# EAGLE design fuente (EAGLE 9.6.2)
Fuente ±16 V / 1,5 A y +5 V (v2.2) - Brahiam Alberto Campiño Romero
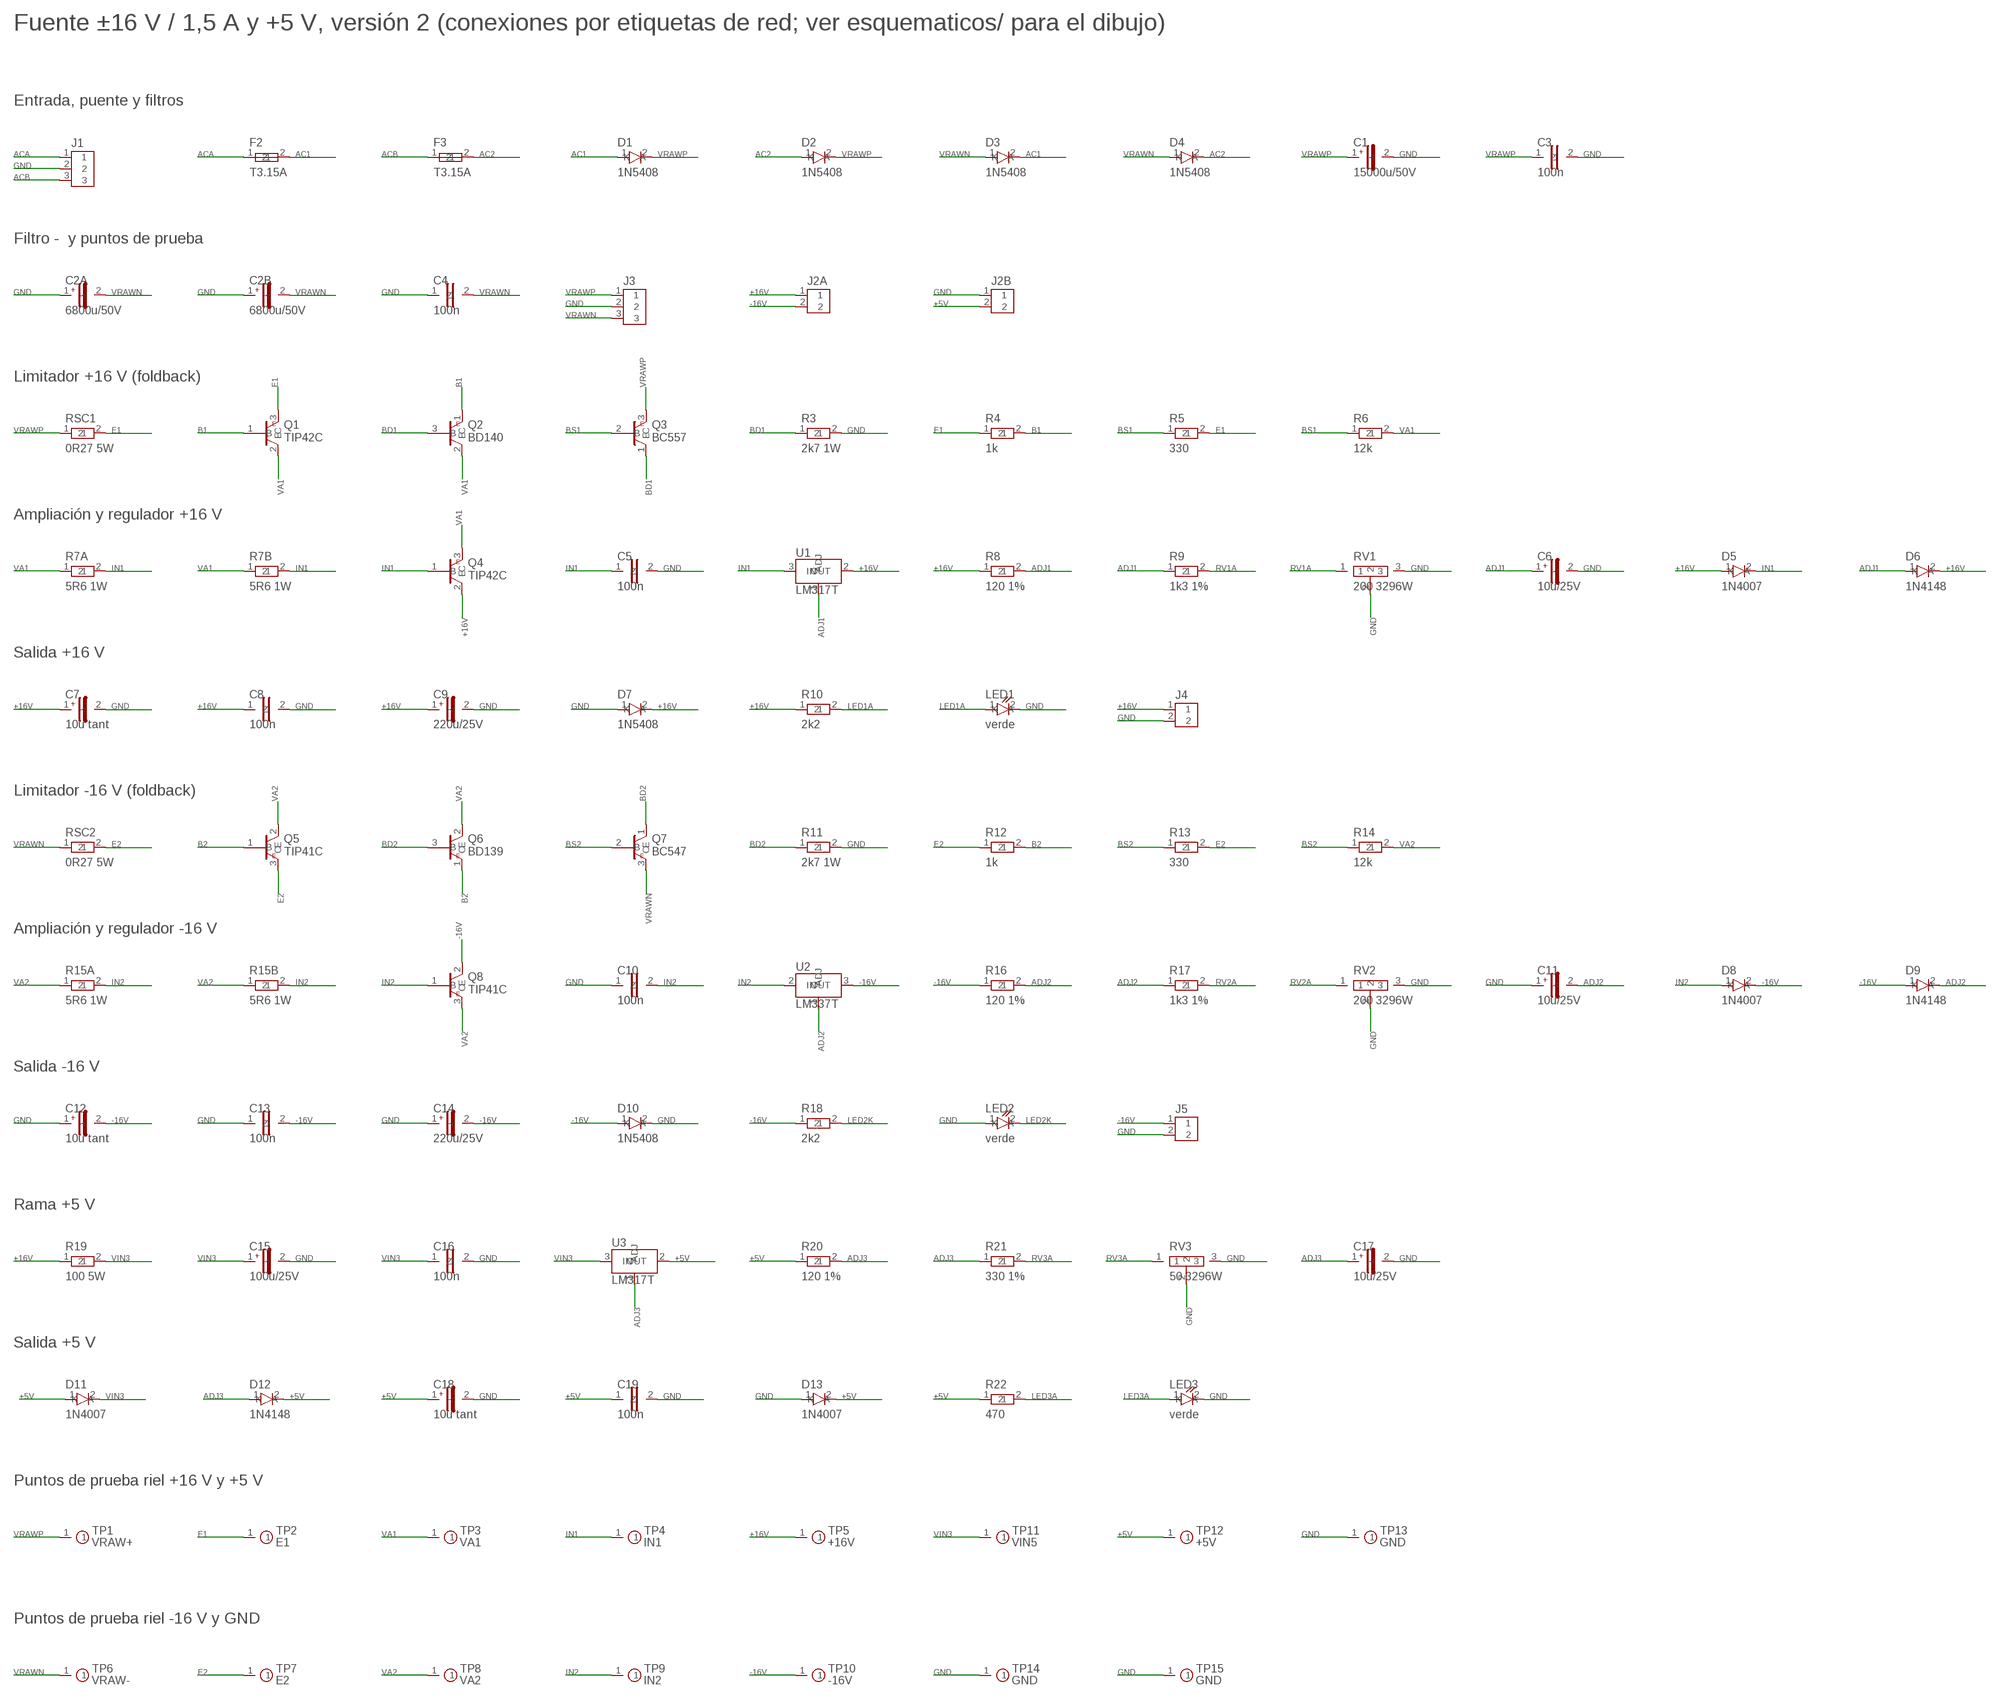
[diagram p0: schematic, sheet 1]

## Parts
C1  15000u/50V  CPOL35  [CPOL35]
C2A  6800u/50V  CPOL25  [CPOL25]
C2B  6800u/50V  CPOL25  [CPOL25]
C3  100n  C  [CAP]
C4  100n  C  [CAP]
C5  100n  C  [CAP]
C6  10u/25V  CPOL5  [CPOL5]
C7  10u tant  CTANT  [CTANT]
C8  100n  C  [CAP]
C9  220u/25V  CPOL8  [CPOL8]
C10  100n  C  [CAP]
C11  10u/25V  CPOL5  [CPOL5]
C12  10u tant  CTANT  [CTANT]
C13  100n  C  [CAP]
C14  220u/25V  CPOL8  [CPOL8]
C15  100u/25V  CPOL6  [CPOL6]
C16  100n  C  [CAP]
C17  10u/25V  CPOL5  [CPOL5]
C18  10u tant  CTANT  [CTANT]
C19  100n  C  [CAP]
D1  1N5408  D201  [DIODE]
D2  1N5408  D201  [DIODE]
D3  1N5408  D201  [DIODE]
D4  1N5408  D201  [DIODE]
D5  1N4007  D41  [DO41]
D6  1N4148  D35  [DO35]
D7  1N5408  D201  [DIODE]
D8  1N4007  D41  [DO41]
D9  1N4148  D35  [DO35]
D10  1N5408  D201  [DIODE]
D11  1N4007  D41  [DO41]
D12  1N4148  D35  [DO35]
D13  1N4007  D41  [DO41]
F2  T3.15A  FUSE  [FUSE]
F3  T3.15A  FUSE  [FUSE]
J1  SEC 18-0-18  TERM3  [TERM3]
J2A  +16/-16  TERM2  [TERM2]
J2B  GND/+5  TERM2  [TERM2]
J3  TP  HDR3  [HDR3]
J4  RL +16  TERM2  [TERM2]
J5  RL -16  TERM2  [TERM2]
LED1  verde  LED  [LED5]
LED2  verde  LED  [LED5]
LED3  verde  LED  [LED5]
Q1  TIP42C  [TO220]
Q2  BD140  [TO126]
Q3  BC557  [TO92]
Q4  TIP42C  [TO220]
Q5  TIP41C  [TO220]
Q6  BD139  [TO126]
Q7  BC547  [TO92]
Q8  TIP41C  [TO220]
R3  2k7 1W  R1W  [RES1W]
R4  1k  R10  [RES10]
R5  330  R10  [RES10]
R6  12k  R10  [RES10]
R7A  5R6 1W  R1W  [RES1W]
R7B  5R6 1W  R1W  [RES1W]
R8  120 1%  R10  [RES10]
R9  1k3 1%  R10  [RES10]
R10  2k2  R10  [RES10]
R11  2k7 1W  R1W  [RES1W]
R12  1k  R10  [RES10]
R13  330  R10  [RES10]
R14  12k  R10  [RES10]
R15A  5R6 1W  R1W  [RES1W]
R15B  5R6 1W  R1W  [RES1W]
R16  120 1%  R10  [RES10]
R17  1k3 1%  R10  [RES10]
R18  2k2  R10  [RES10]
R19  100 5W  R3W  [RES3W]
R20  120 1%  R10  [RES10]
R21  330 1%  R10  [RES10]
R22  470  R10  [RES10]
RSC1  0R27 5W  R5W  [RES5W]
RSC2  0R27 5W  R5W  [RES5W]
RV1  200 3296W  TRIM  [TRIM]
RV2  200 3296W  TRIM  [TRIM]
RV3  50 3296W  TRIM  [TRIM]
TP1  VRAW+  TP  [TP]
TP2  E1  TP  [TP]
TP3  VA1  TP  [TP]
TP4  IN1  TP  [TP]
TP5  +16V  TP  [TP]
TP6  VRAW-  TP  [TP]
TP7  E2  TP  [TP]
TP8  VA2  TP  [TP]
TP9  IN2  TP  [TP]
TP10  -16V  TP  [TP]
TP11  VIN5  TP  [TP]
TP12  +5V  TP  [TP]
TP13  GND  TP  [TP]
TP14  GND  TP  [TP]
TP15  GND  TP  [TP]
U1  LM317T  [TO220]
U2  LM337T  [TO220]
U3  LM317T  [TO220]

## Nets
+5V: C18.1(+) C19.1 D11.1(A) D12.2(K) D13.2(K) J2B.2 R20.1 R22.1 TP12.1 U3.2(OUT)
+16V: C7.1(+) C8.1 C9.1(+) D5.1(A) D6.2(K) D7.2(K) J2A.1 J4.1 Q4.2(C) R8.1 R10.1 R19.1 TP5.1 U1.2(OUT)
-16V: C12.2(-) C13.2 C14.2(-) D8.2(K) D9.1(A) D10.1(A) J2A.2 J5.1 Q8.2(C) R16.1 R18.1 TP10.1 U2.3(OUT)
AC1: D1.1(A) D3.2(K) F2.2
AC2: D2.1(A) D4.2(K) F3.2
ACA: F2.1 J1.1
ACB: F3.1 J1.3
ADJ1: C6.1(+) D6.1(A) R8.2 R9.1 U1.1(ADJ)
ADJ2: C11.2(-) D9.2(K) R16.2 R17.1 U2.1(ADJ)
ADJ3: C17.1(+) D12.1(A) R20.2 R21.1 U3.1(ADJ)
B1: Q1.1(B) Q2.1(E) R4.2
B2: Q5.1(B) Q6.1(E) R12.2
BD1: Q2.3(B) Q3.1(C) R3.1
BD2: Q6.3(B) Q7.1(C) R11.1
BS1: Q3.2(B) R5.1 R6.1
BS2: Q7.2(B) R13.1 R14.1
E1: Q1.3(E) R4.1 R5.2 RSC1.2 TP2.1
E2: Q5.3(E) R12.1 R13.2 RSC2.2 TP7.1
GND: C1.2(-) C2A.1(+) C2B.1(+) C3.2 C4.1 C5.2 C6.2(-) C7.2(-) C8.2 C9.2(-) C10.1 C11.1(+) C12.1(+) C13.1 C14.1(+) C15.2(-) C16.2 C17.2(-) C18.2(-) C19.2 D7.1(A) D10.2(K) D13.1(A) J1.2 J2B.1 J3.2 J4.2 J5.2 LED1.2(K) LED2.1(A) LED3.2(K) R3.2 R11.2 RV1.2 RV1.3 RV2.2 RV2.3 RV3.2 RV3.3 TP13.1 TP14.1 TP15.1
IN1: C5.1 D5.2(K) Q4.1(B) R7A.2 R7B.2 TP4.1 U1.3(IN)
IN2: C10.2 D8.1(A) Q8.1(B) R15A.2 R15B.2 TP9.1 U2.2(IN)
LED1A: LED1.1(A) R10.2
LED2K: LED2.2(K) R18.2
LED3A: LED3.1(A) R22.2
RV1A: R9.2 RV1.1
RV2A: R17.2 RV2.1
RV3A: R21.2 RV3.1
VA1: Q1.2(C) Q2.2(C) Q4.3(E) R6.2 R7A.1 R7B.1 TP3.1
VA2: Q5.2(C) Q6.2(C) Q8.3(E) R14.2 R15A.1 R15B.1 TP8.1
VIN3: C15.1(+) C16.1 D11.2(K) R19.2 TP11.1 U3.3(IN)
VRAWN: C2A.2(-) C2B.2(-) C4.2 D3.1(A) D4.1(A) J3.3 Q7.3(E) RSC2.1 TP6.1
VRAWP: C1.1(+) C3.1 D1.2(K) D2.2(K) J3.1 Q3.3(E) RSC1.1 TP1.1

## Notes on the sheet
- Fuente ±16 V / 1,5 A y +5 V, versión 2 (conexiones por etiquetas de red; ver esquematicos/ para el dibujo)
- Entrada, puente y filtros
- Filtro -  y puntos de prueba
- Limitador +16 V (foldback)
- Ampliación y regulador +16 V
- Salida +16 V
- Limitador -16 V (foldback)
- Ampliación y regulador -16 V
- Salida -16 V
- Rama +5 V
- Salida +5 V
- Puntos de prueba riel +16 V y +5 V
- Puntos de prueba riel -16 V y GND

## Library data of the parts
C1 = fuente16:CPOL35
C2A C2B = fuente16:CPOL25
C3-C5 C8 C10 C13 C16 C19 = fuente16:C
C6 C11 C17 = fuente16:CPOL5
C7 C12 C18 = fuente16:CTANT
C9 C14 = fuente16:CPOL8
C15 = fuente16:CPOL6
D1-D4 D7 D10 = fuente16:D201
D5 D8 D11 D13 = fuente16:D41
D6 D9 D12 = fuente16:D35
F2 F3 = fuente16:FUSE
J1 = fuente16:TERM3
J2A J2B J4 J5 = fuente16:TERM2
J3 = fuente16:HDR3
LED1-LED3 = fuente16:LED
Q1 Q4 = fuente16:TIP42C
Q2 = fuente16:BD140
Q3 = fuente16:BC557
Q5 Q8 = fuente16:TIP41C
Q6 = fuente16:BD139
Q7 = fuente16:BC547
R3 R7A R7B R11 R15A R15B = fuente16:R1W
R4-R6 R8-R10 R12-R14 R16-R18 R20-R22 = fuente16:R10
R19 = fuente16:R3W
RSC1 RSC2 = fuente16:R5W
RV1-RV3 = fuente16:TRIM
TP1-TP15 = fuente16:TP
U1 U3 = fuente16:LM317T
U2 = fuente16:LM337T

## Board
Fuente ±16 V / 1,5 A y +5 V (v2.2), una cara (cobre inferior) con puentes de alambre
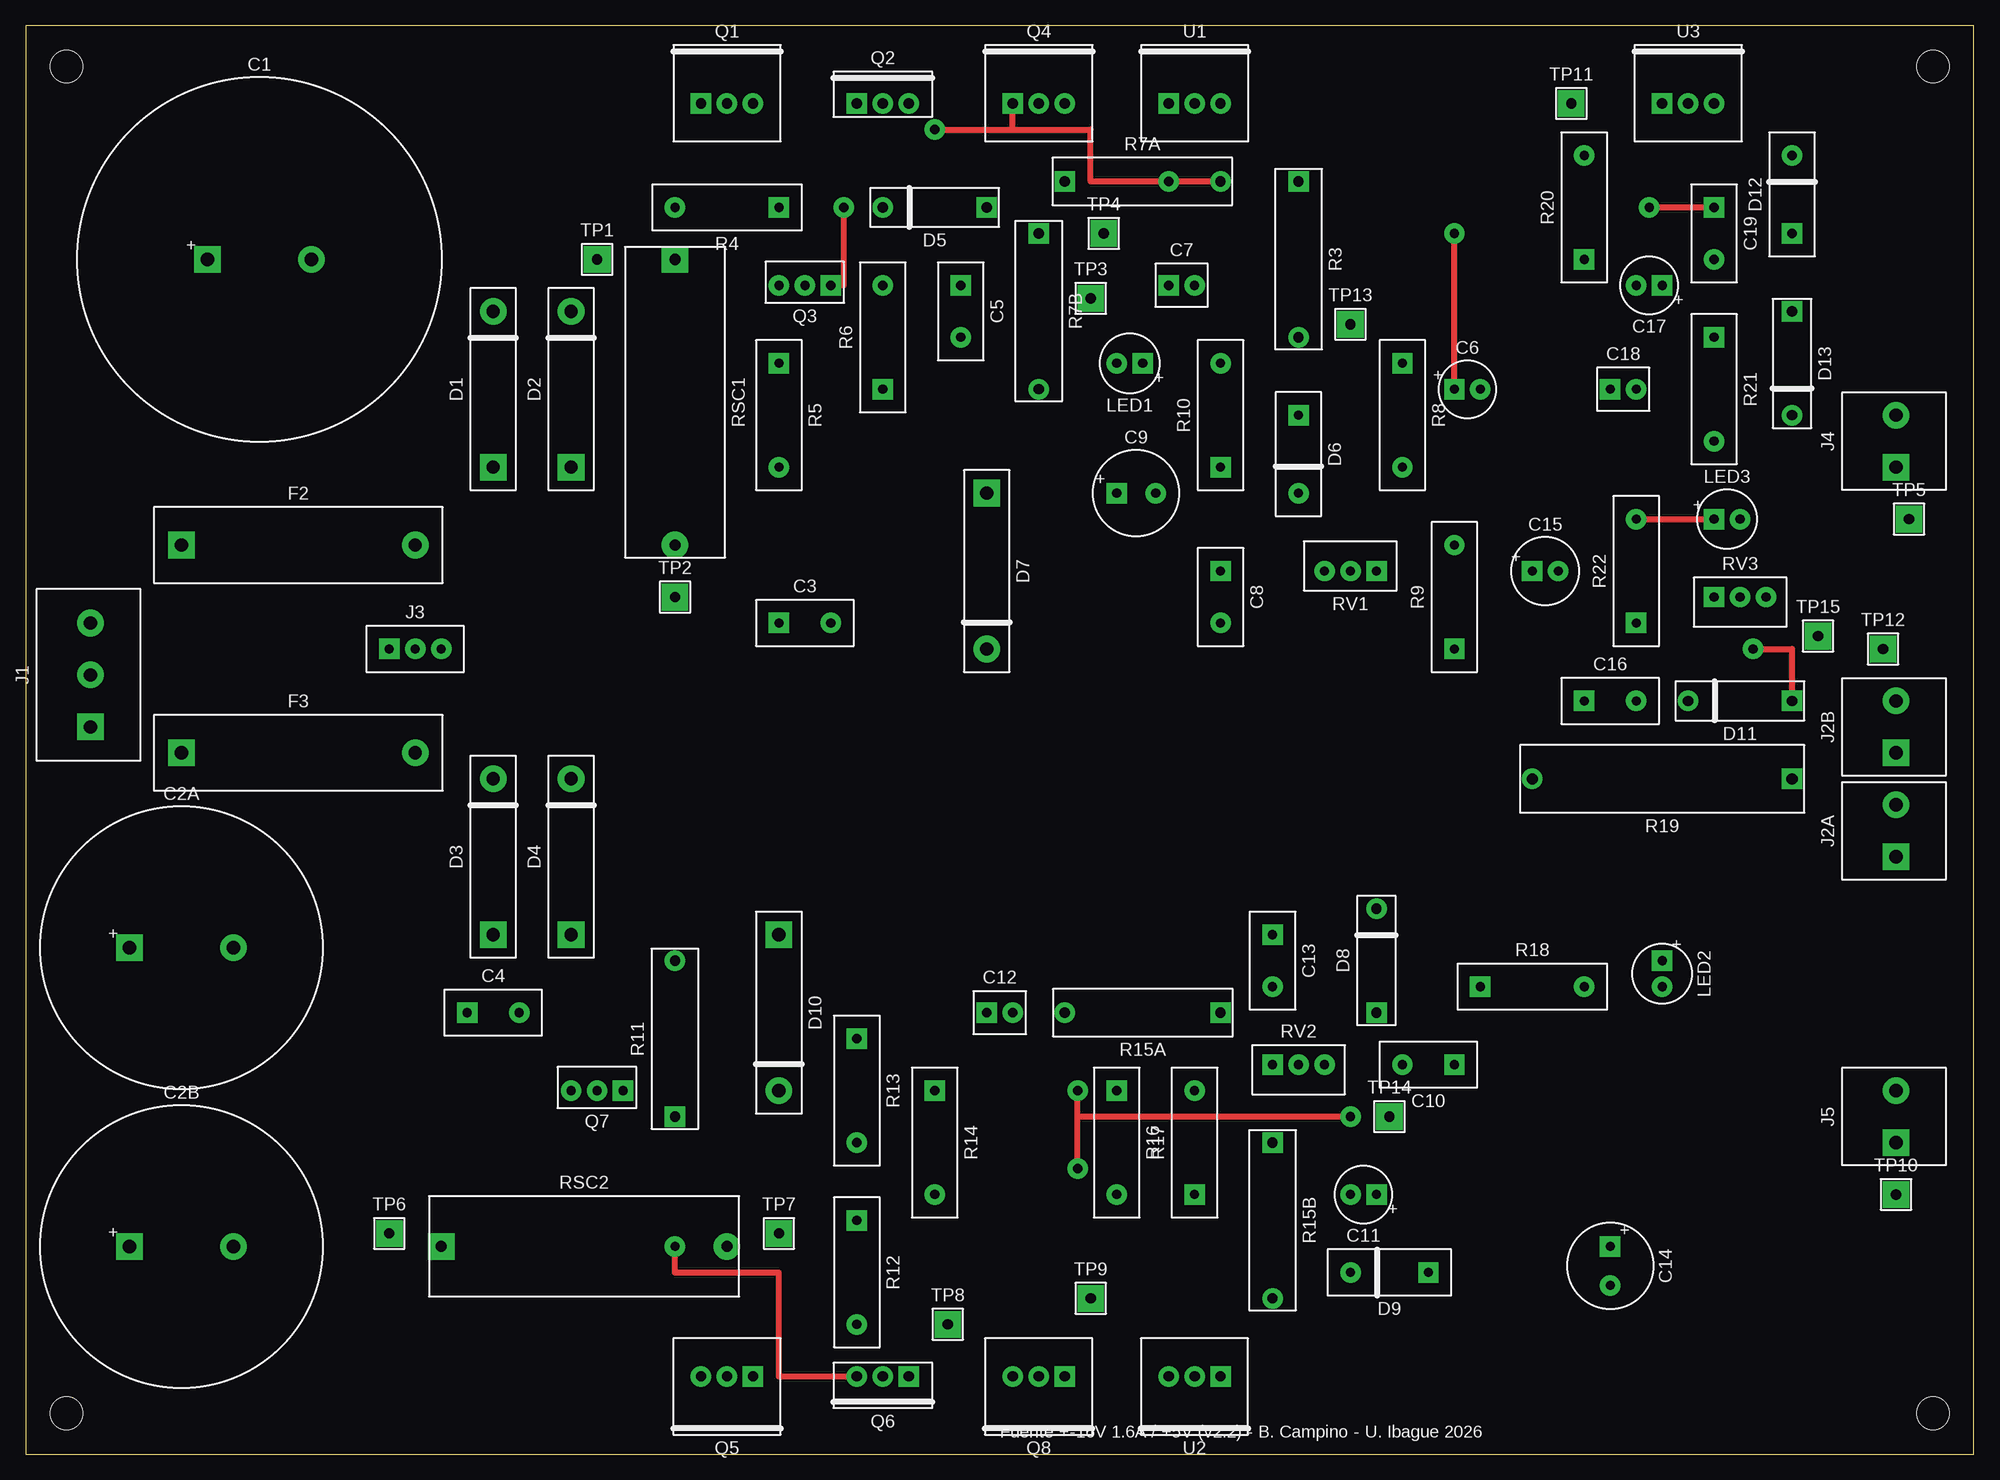
[diagram p1: board, top side]
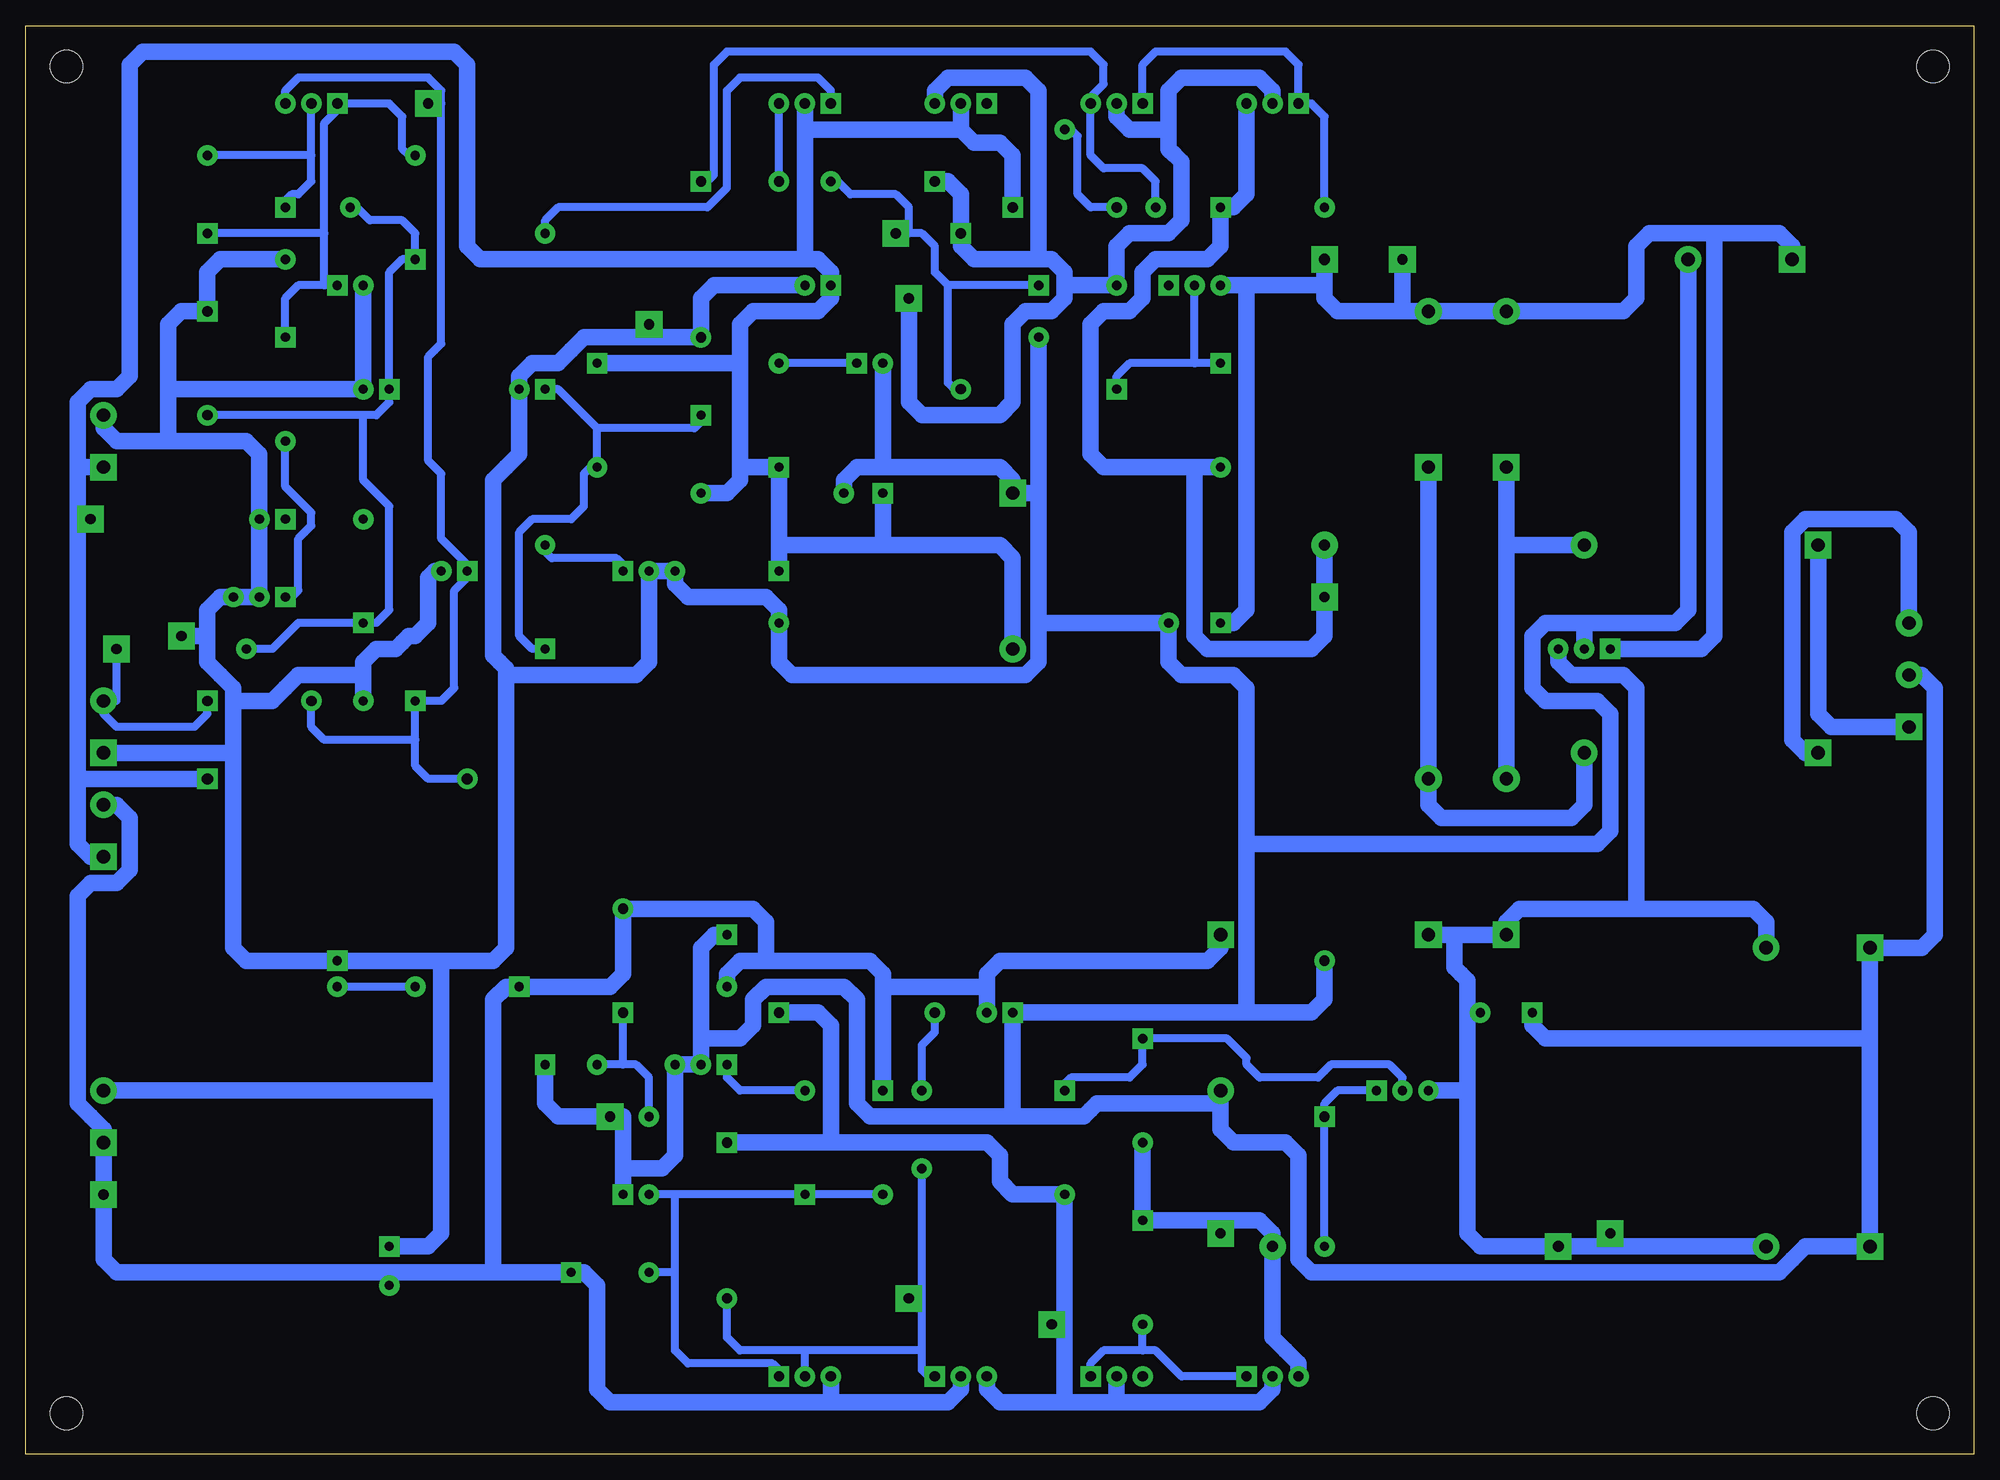
[diagram p2: board, bottom side, seen from below]

Size 190.5 x 139.7 mm. Coordinates in mm from the lower left corner, seen from the top.
Outline: 0,0 190.5,0 190.5,139.7 0,139.7 0,0
Copper layers (1*16): Top / Bottom
Design rules "default": minimum track width 0.8mm, minimum drill 0.9mm, track to track 0.4mm, track to pad 0.4mm, pad to pad 0.4mm, via to via 0.4mm, copper to edge 0.6mm
Holes 3.2 mm at 4,4 186.5,4 4,135.7 186.5,135.7

### Footprints (pad centres in the part's own frame; a part is rotated, then mirrored left to right if it is on the bottom)
CPOL35 = drill 1.3 pad 2.6 square: 1 0,0 | drill 1.3 pad 2.6 round: 2 10.16,0
CPOL25 = drill 1.3 pad 2.6 square: 1 0,0 | drill 1.3 pad 2.6 round: 2 10.16,0
CAP = drill 0.9 pad 2 square: 1 0,0 | drill 0.9 pad 2 round: 2 5.08,0
CPOL5 = drill 0.9 pad 2 square: 1 0,0 | drill 0.9 pad 2 round: 2 2.54,0
CTANT = drill 0.9 pad 2 square: 1 0,0 | drill 0.9 pad 2 round: 2 2.54,0
CPOL8 = drill 0.9 pad 2 square: 1 0,0 | drill 0.9 pad 2 round: 2 3.81,0
CPOL6 = drill 0.9 pad 2 square: 1 0,0 | drill 0.9 pad 2 round: 2 2.54,0
DIODE = drill 1.3 pad 2.6 square: 1 0,0 | drill 1.3 pad 2.6 round: 2 15.24,0
DO41 = drill 1 pad 2 square: 1 0,0 | drill 1 pad 2 round: 2 10.16,0
DO35 = drill 0.9 pad 2 square: 1 0,0 | drill 0.9 pad 2 round: 2 7.62,0
FUSE = drill 1.3 pad 2.6 square: 1 0,0 | drill 1.3 pad 2.6 round: 2 22.86,0
TERM3 = drill 1.3 pad 2.6 square: 1 0,0 | drill 1.3 pad 2.6 round: 2 5.08,0; 3 10.16,0
TERM2 = drill 1.3 pad 2.6 square: 1 0,0 | drill 1.3 pad 2.6 round: 2 5.08,0
HDR3 = drill 0.9 pad 2 square: 1 0,0 | drill 0.9 pad 2 round: 2 2.54,0; 3 5.08,0
LED5 = drill 0.9 pad 2 square: 1 0,0 | drill 0.9 pad 2 round: 2 2.54,0
TO220 = drill 1 pad 2 square: 1 0,0 | drill 1 pad 2 round: 2 2.54,0; 3 5.08,0
TO126 = drill 1 pad 2 square: 1 0,0 | drill 1 pad 2 round: 2 2.54,0; 3 5.08,0
TO92 = drill 0.9 pad 2 square: 1 0,0 | drill 0.9 pad 2 round: 2 2.54,0; 3 5.08,0
RES1W = drill 1 pad 2 square: 1 0,0 | drill 1 pad 2 round: 2 15.24,0
RES10 = drill 0.9 pad 2 square: 1 0,0 | drill 0.9 pad 2 round: 2 10.16,0
RES3W = drill 1.1 pad 2 square: 1 0,0 | drill 1.1 pad 2 round: 2 25.4,0
RES5W = drill 1.1 pad 2.6 square: 1 0,0 | drill 1.1 pad 2.6 round: 2 27.94,0
TRIM = drill 0.9 pad 2 square: 1 0,0 | drill 0.9 pad 2 round: 2 2.54,0; 3 5.08,0
TP = drill 1 pad 2.6 square: 1 0,0

### Placement (x,y rotation side)
C1  17.78,116.84 0 top
C2A  10.16,49.53 0 top
C2B  10.16,20.32 0 top
C3  73.66,81.28 0 top
C4  43.18,43.18 0 top
C5  91.44,114.3 270 top
C6  139.7,104.14 0 top
C7  111.76,114.3 0 top
C8  116.84,86.36 270 top
C9  106.68,93.98 0 top
C10  139.7,38.1 180 top
C11  132.08,25.4 180 top
C12  93.98,43.18 0 top
C13  121.92,50.8 270 top
C14  154.94,20.32 270 top
C15  147.32,86.36 0 top
C16  152.4,73.66 0 top
C17  160.02,114.3 180 top
C18  154.94,104.14 0 top
C19  165.1,121.92 270 top
D1  45.72,96.52 90 top
D2  53.34,96.52 90 top
D3  45.72,50.8 90 top
D4  53.34,50.8 90 top
D5  93.98,121.92 180 top
D6  124.46,101.6 270 top
D7  93.98,93.98 270 top
D8  132.08,43.18 90 top
D9  137.16,17.78 180 top
D10  73.66,50.8 270 top
D11  172.72,73.66 180 top
D12  172.72,119.38 90 top
D13  172.72,111.76 270 top
F2  15.24,88.9 0 top
F3  15.24,68.58 0 top
J1  6.35,71.12 90 top
J2A  182.88,58.42 90 top
J2B  182.88,68.58 90 top
J3  35.56,78.74 0 top
J4  182.88,96.52 90 top
J5  182.88,30.48 90 top
LED1  109.22,106.68 180 top
LED2  160.02,48.26 270 top
LED3  165.1,91.44 0 top
Q1  66.04,132.08 0 top
Q2  81.28,132.08 0 top
Q3  78.74,114.3 180 top
Q4  96.52,132.08 0 top
Q5  71.12,7.62 180 top
Q6  86.36,7.62 180 top
Q7  58.42,35.56 180 top
Q8  101.6,7.62 180 top
R3  124.46,124.46 270 top
R4  73.66,121.92 180 top
R5  73.66,106.68 270 top
R6  83.82,104.14 90 top
R7A  101.6,124.46 0 top
R7B  99.06,119.38 270 top
R8  134.62,106.68 270 top
R9  139.7,78.74 90 top
R10  116.84,96.52 90 top
R11  63.5,33.02 90 top
R12  81.28,22.86 270 top
R13  81.28,40.64 270 top
R14  88.9,35.56 270 top
R15A  116.84,43.18 180 top
R15B  121.92,30.48 270 top
R16  106.68,35.56 270 top
R17  114.3,25.4 90 top
R18  142.24,45.72 0 top
R19  172.72,66.04 180 top
R20  152.4,116.84 90 top
R21  165.1,109.22 270 top
R22  157.48,81.28 90 top
RSC1  63.5,116.84 270 top
RSC2  40.64,20.32 0 top
RV1  132.08,86.36 180 top
RV2  121.92,38.1 0 top
RV3  165.1,83.82 0 top
TP1  55.88,116.84 0 top
TP2  63.5,83.82 0 top
TP3  104.14,113.03 0 top
TP4  105.41,119.38 0 top
TP5  184.15,91.44 0 top
TP6  35.56,21.59 0 top
TP7  73.66,21.59 0 top
TP8  90.17,12.7 0 top
TP9  104.14,15.24 0 top
TP10  182.88,25.4 0 top
TP11  151.13,132.08 0 top
TP12  181.61,78.74 0 top
TP13  129.54,110.49 0 top
TP14  133.35,33.02 0 top
TP15  175.26,80.01 0 top
U1  111.76,132.08 0 top
U2  116.84,7.62 180 top
U3  160.02,132.08 0 top

### Tracks (layer width: path | path; a pad name or v marks a point on that pad's centre or on a via)
+5V  (via drill 0.9 pad 2)
  Top 0.6: v168.91,78.74 172.72,78.74 D11.1 | v158.75,121.92 C19.1
  Bottom 0.8: v168.91,78.74 166.37,78.74 165.1,80.01 | 156.21,93.98 | D13.2 156.21,101.6 154.94,102.87 154.94,115.57 153.67,116.84 R20.1 152.4,119.38 153.67,120.65 156.84,120.65 157.48,121.28 | v158.75,121.92 158.12,121.92 157.48,121.28 | 162.56,127 D12.2 | 157.48,101.6 157.48,95.25 156.21,93.98 | 157.48,121.28 | U3.2 162.56,124.46 163.83,123.19 164.47,123.19 165.1,122.56 C19.1 | 165.1,80.01 | D11.1 172.72,72.39 173.99,71.12 181.61,71.12 182.88,72.39 J2B.2 181.61,73.66 TP12.1 | 165.1,80.01 163.83,81.28 156.21,81.28 154.94,82.55 154.94,92.71 156.21,93.98
+16V
  Bottom 1.6: J2A.1 184.15,58.42 185.42,59.69 185.42,102.87 184.15,104.14 181.61,104.14 180.34,105.41 180.34,135.89 179.07,137.16 148.59,137.16 147.32,135.89 147.32,118.11 146.05,116.84 113.03,116.84 111.76,115.57 111.76,113.03 113.03,111.76 119.38,111.76 120.65,110.49 120.65,95.25 121.92,93.98 D6.2 | R19.1 185.42,66.04 | 116.84,88.9 95.25,88.9 93.98,87.63 D7.2 | TP5.1 185.42,91.44 | 120.65,96.52 R10.1 C8.1 | J4.1 185.42,96.52 | 120.65,106.68 R8.1 | 99.06,129.54 114.3,129.54 | D5.1 93.98,127 95.25,128.27 97.79,128.27 99.06,129.54 | 99.06,129.54 Q4.2 | 106.68,88.9 C9.1 | 114.3,116.84 U1.2
-16V
  Bottom 1.6: 184.15,33.02 | 96.52,45.72 106.68,45.72 | J2A.2 181.61,63.5 180.34,62.23 180.34,57.15 181.61,55.88 184.15,55.88 185.42,54.61 185.42,34.29 184.15,33.02 | D10.1 73.66,49.53 74.93,48.26 95.25,48.26 96.52,46.99 C12.2 | Q8.2 99.06,6.35 100.33,5.08 133.35,5.08 134.62,6.35 134.62,16.51 135.89,17.78 181.61,17.78 182.88,19.05 182.88,31.75 184.15,33.02 | R16.1 106.68,46.99 107.95,48.26 120.65,48.26 121.92,46.99 C13.2 | 111.76,5.08 U2.3 | 118.11,48.26 118.11,52.07 119.38,53.34 D8.2 132.08,46.99 133.35,45.72 143.51,45.72 144.78,44.45 144.78,17.78 | C14.2 154.94,17.78
AC1
  Bottom 1.6: F2.2 45.72,88.9 | D3.2 D1.1
AC2
  Bottom 1.6: F3.2 38.1,63.5 39.37,62.23 52.07,62.23 53.34,63.5 D2.1
ACA
  Bottom 1.6: J1.1 13.97,71.12 15.24,72.39 F2.1
ACB
  Bottom 1.6: F3.1 16.51,68.58 17.78,69.85 17.78,90.17 16.51,91.44 7.62,91.44 6.35,90.17 J1.3
ADJ1  (via drill 0.9 pad 2)
  Top 0.6: C6.1 v139.7,119.38
  Bottom 0.8: R9.1 140.97,78.74 142.24,80.01 142.24,90.17 140.97,91.44 137.16,91.44 135.89,92.71 135.89,95.89 135.25,96.52 R8.2 134.62,100.33 | 134.62,100.33 125.09,100.33 124.46,100.97 D6.1 | 135.89,101.6 | C6.1 138.43,104.14 137.16,102.87 | 122.56,123.19 | U1.1 111.76,133.35 113.03,134.62 120.65,134.62 121.92,133.35 121.92,123.83 122.56,123.19 | 123.19,122.56 | 137.16,102.87 | v139.7,119.38 139.7,120.65 138.43,121.92 123.83,121.92 123.19,122.56 | 135.89,101.6 134.62,100.33 | 135.89,101.6 137.16,102.87 | 122.56,123.19 123.19,122.56
ADJ2
  Bottom 0.8: 127,17.78 D9.2 | R16.2 C11.2 | U2.1 116.84,8.26 117.47,8.89 125.73,8.89 127,10.16 127,25.4
ADJ3
  Bottom 0.8: C17.1 163.83,114.3 165.1,113.03 R21.1 | 161.29,119.38 D12.1 | R20.2 153.03,127 153.67,127.64 153.67,130.81 154.94,132.08 U3.1 160.02,131.44 160.66,130.81 | 160.66,130.81 | 161.29,114.3 161.29,130.18 160.66,130.81
B1
  Bottom 0.8: R4.2 63.5,130.81 64.77,132.08 Q1.1 66.04,135.89 67.31,137.16 80.01,137.16 81.28,135.89 Q2.1
B2
  Bottom 0.8: Q5.1 77.47,7.62 78.74,8.89 | 78.74,8.89 | 81.28,10.16 R12.2 | Q6.1 86.36,8.89 85.09,10.16 80.01,10.16 78.74,8.89
BD1  (via drill 0.9 pad 2)
  Top 0.6: Q3.1 80.01,114.3 v80.01,121.92
  Bottom 0.8: R3.1 123.83,124.46 123.19,125.09 123.19,135.89 121.92,137.16 86.36,137.16 85.09,135.89 85.09,133.99 85.72,133.35 | 85.72,133.35 | v80.01,121.92 80.01,124.46 81.28,125.73 85.09,125.73 86.36,127 86.36,132.72 85.72,133.35
BD2  (via drill 0.9 pad 2)
  Top 0.6: Q6.3 73.66,7.62 73.66,17.78 63.5,17.78 v63.5,20.32
  Bottom 0.8: Q7.1 62.23,35.56 63.5,34.29 v63.5,20.32
BS1
  Bottom 0.8: R5.1 82.55,106.68 83.82,105.41 R6.1 | 76.2,106.68 Q3.2
BS2
  Bottom 0.8: 71.75,39.37 | Q7.2 55.88,36.83 57.15,38.1 62.87,38.1 63.5,37.47 | 63.5,37.47 | 72.39,40.01 | R14.1 88.9,36.2 88.27,36.83 82.55,36.83 81.28,38.1 R13.1 73.03,40.64 72.39,40.01 | 63.5,37.47 64.14,36.83 69.85,36.83 71.12,38.1 71.12,38.73 71.75,39.37 | 71.75,39.37 72.39,40.01
E1
  Bottom 1.6: R5.2 85.09,96.52 86.36,97.79 86.36,110.49 85.09,111.76 82.55,111.76 81.28,113.03 81.28,115.57 80.01,116.84 74.93,116.84 73.66,118.11 R4.1 72.39,121.92 71.12,123.19 Q1.3 | RSC1.2 63.5,80.01 64.77,78.74 74.93,78.74 76.2,80.01 76.2,96.52
E2
  Bottom 1.6: 67.31,10.16 | Q5.3 66.04,8.89 67.31,10.16 | TP7.1 73.66,22.86 | R13.2 R12.1 69.85,22.86 68.58,21.59 68.58,11.43 67.31,10.16
GND
  Bottom 1.6: C14.1 151.13,20.32 149.86,21.59 149.86,48.26 | 132.08,27.94 128.27,27.94 127,29.21 RV2.3 RV2.2 124.46,49.53 123.19,50.8 C13.1 | 73.66,34.29 85.72,34.29 86.36,33.66 | 149.86,35.56 J5.2 | 10.16,40.64 41.91,40.64 43.18,41.91 C4.1 | 124.46,40.64 120.65,40.64 119.38,41.91 119.38,44.45 118.11,45.72 110.49,45.72 109.22,44.45 109.22,34.29 107.95,33.02 87,33.02 86.36,33.66 | 71.12,59.69 36.83,59.69 35.56,60.96 35.56,72.39 36.83,73.66 41.91,73.66 43.18,74.93 43.18,80.01 41.91,81.28 29.21,81.28 27.94,82.55 C1.2 | 170.18,68.58 J2B.1 | 170.18,73.66 166.37,73.66 165.1,74.93 | J1.2 5.08,76.2 3.81,74.93 3.81,50.8 5.08,49.53 C2A.1 C2B.1 16.51,20.32 17.78,19.05 | 143.51,76.2 130.81,76.2 129.54,77.47 RV1.2 RV1.3 127,85.09 125.73,83.82 118.11,83.82 116.84,82.55 116.84,77.47 115.57,76.2 92.71,76.2 91.44,77.47 C5.2 | 157.48,76.2 163.83,76.2 165.1,74.93 | 171.45,76.2 | 144.15,77.47 | 172.72,80.01 TP15.1 | 91.44,81.28 C3.2 78.74,77.47 77.47,76.2 72.39,76.2 71.12,74.93 71.12,43.18 | C15.2 150.5,86.36 151.13,85.72 151.13,81.28 152.4,80.01 153.03,80.01 153.67,79.38 | 91.44,93.98 D7.1 93.98,95.25 95.25,96.52 109.22,96.52 110.49,95.25 C9.2 | 143.51,96.52 | 176.53,104.14 C18.2 C17.2 | C7.2 123.19,114.3 124.46,113.03 R3.2 135.89,109.22 137.16,107.95 | C19.2 171.45,116.84 172.72,115.57 D13.1 175.26,111.76 176.53,110.49 176.53,99.06 | 17.78,19.05 | J3.2 38.1,81.28 | R11.2 63.5,44.45 64.77,43.18 C12.1 93.98,33.02 | D10.2 73.66,31.75 72.39,30.48 67.31,30.48 66.04,29.21 66.04,19.05 64.77,17.78 19.05,17.78 17.78,19.05 | 86.36,33.66 | 106.68,96.52 LED1.2 | 129.54,109.22 TP13.1 | C11.1 132.08,33.02 138.43,33.02 139.7,34.29 C10.1
  Bottom 1.6: 137.16,107.95 | 153.67,79.38 | C16.2 157.48,77.47 156.21,78.74 154.31,78.74 153.67,79.38 | 165.1,74.93 | J4.2 182.88,100.33 181.61,99.06 168.91,99.06 167.64,97.79 RV3.2 171.45,83.82 172.72,82.55 172.72,77.47 171.45,76.2 | 171.45,76.2 170.18,74.93 170.18,49.53 168.91,48.26 144.78,48.26 143.51,49.53 143.51,76.83 144.15,77.47 | 144.15,77.47 144.78,78.11 144.78,95.25 143.51,96.52 | 143.51,96.52 142.24,97.79 142.24,105.41 140.97,106.68 138.43,106.68 137.16,107.95
IN1  (via drill 0.9 pad 2)
  Top 0.6: R7A.2 104.14,124.46 104.14,129.54 v88.9,129.54 | 96.52,129.54 Q4.1
  Bottom 0.8: R7B.2 99.69,104.14 100.33,104.78 100.33,114.3 | C5.1 100.33,114.3 | TP4.1 102.87,119.38 101.6,118.11 101.6,115.57 100.33,114.3 | D5.2 86.36,121.92 87.63,123.19 87.63,128.91 88.27,129.54 v88.9,129.54 | v111.76,124.46 111.12,124.46 110.49,123.83 | 104.14,119.38 104.14,121.92 105.41,123.19 109.86,123.19 110.49,123.83 | 110.49,123.83 | R7A.2 U1.3
IN2  (via drill 0.9 pad 2)
  Top 0.6: 102.87,33.02 v129.54,33.02 | v102.87,27.94 v102.87,35.56
  Bottom 0.8: Q8.1 102.23,7.62 102.87,8.26 v102.87,27.94 | 102.87,10.16 120.65,10.16 121.92,11.43 R15B.2 | 102.87,15.24 TP9.1 | C10.2 130.81,38.1 129.54,36.83 v129.54,33.02 | 102.23,40.64 | R15A.2 101.6,41.27 102.23,40.64 | v102.87,35.56 102.87,40.01 102.23,40.64 | U2.2 114.3,10.16 | 132.08,38.1 D8.1
LED1A
  Bottom 0.8: LED1.1 R10.2
LED2K
  Bottom 0.8: R18.2 LED2.2
LED3A
  Top 0.6: R22.2 LED3.1
RV1A
  Bottom 0.8: RV1.1 132.08,87 132.72,87.63 139.06,87.63 139.7,88.27 R9.2
RV2A
  Bottom 0.8: R17.2 120.65,35.56 121.92,36.83 RV2.1
RV3A
  Bottom 0.8: RV3.1 164.47,83.82 163.83,84.45 163.83,89.53 163.19,90.17 | 163.19,90.17 | 163.19,92.71 | 164.47,93.98 | 163.83,93.34 | R21.2 165.1,94.61 164.47,93.98 | 163.19,90.17 162.56,90.81 162.56,92.08 163.19,92.71 | 163.19,92.71 163.83,93.34 | 164.47,93.98 163.83,93.34
VA1
  Bottom 1.6: 88.9,114.3 R6.2 83.82,118.11 82.55,119.38 78.74,119.38 77.47,120.65 77.47,126.36 78.11,127 | R7A.1 100.33,124.46 99.06,123.19 99.06,118.11 97.79,116.84 90.17,116.84 88.9,115.57 88.9,113.03 90.17,111.76 92.71,111.76 93.98,110.49 93.98,102.87 95.25,101.6 102.87,101.6 104.14,102.87 TP3.1 | 78.11,127 | 78.74,129.54 82.55,129.54 83.82,130.81 Q2.2 | Q1.2 68.58,133.35 69.85,134.62 77.47,134.62 78.74,133.35 78.74,127.64 78.11,127 | 91.44,116.84 91.44,133.35 92.71,134.62 100.33,134.62 101.6,133.35 Q4.3
VA2
  Bottom 1.6: 88.9,12.7 TP8.1 | R15B.1 96.52,30.48 95.25,29.21 95.25,26.67 93.98,25.4 R14.2 88.9,5.08 | R15A.1 113.03,43.18 111.76,41.91 111.76,30.48 | Q5.2 68.58,6.35 69.85,5.08 95.25,5.08 96.52,6.35 Q8.3 | 83.82,5.08 Q6.2
VIN3
  Bottom 0.8: R19.2 151.13,66.04 152.4,67.31 C16.1 149.86,73.66 148.59,74.93 148.59,84.45 147.96,85.09 | 152.4,69.85 161.29,69.85 162.56,71.12 D11.2 | 147.96,85.09 | 147.96,87.63 | 149.22,88.9 | 150.5,96.52 | 150.5,107.95 | 149.86,132.08 TP11.1 | 148.59,88.27 | U3.3 165.1,133.35 163.83,134.62 151.13,134.62 149.86,133.35 149.86,108.58 150.5,107.95 | 147.96,85.09 147.32,85.72 147.32,87 147.96,87.63 | 147.96,87.63 148.59,88.27 | 149.22,88.9 148.59,88.27 | 149.22,88.9 149.86,89.53 149.86,95.89 150.5,96.52 | 150.5,96.52 151.13,97.16 151.13,107.31 150.5,107.95
VRAWN
  Bottom 1.6: C2B.2 48.26,20.32 49.53,21.59 49.53,46.35 50.16,46.99 | 49.53,35.56 Q7.3 | C4.2 49.53,43.18 | 50.16,46.99 | D4.1 D3.1 45.72,52.07 44.45,53.34 21.59,53.34 20.32,52.07 C2A.2 | 33.02,53.34 33.02,74.93 34.29,76.2 39.37,76.2 40.64,77.47 J3.3 | 35.56,20.32 TP6.1 | 50.8,50.8 50.8,47.62 50.16,46.99
VRAWP
  Bottom 1.6: J3.1 26.67,78.74 25.4,80.01 25.4,119.38 | C3.1 72.39,81.28 71.12,82.55 71.12,114.3 | 63.5,114.3 Q3.3 | C1.1 17.78,118.11 19.05,119.38 31.75,119.38 33.02,118.11 33.02,113.03 34.29,111.76 62.23,111.76 63.5,113.03 RSC1.1 | 55.88,111.76 TP1.1

### Text on the board
tPlace: Fuente +-16V 1.6A / +5V (v2.2) - B. Campino - U. Ibague 2026